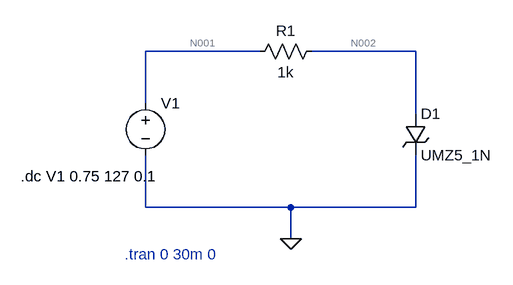
[diagram p0: schematic forward.asc]
forward.asc, the LTspice schematic file:
Version 4.1
SHEET 1 880 680
WIRE 16 128 -160 128
WIRE 256 128 96 128
WIRE -160 208 -160 128
WIRE 256 224 256 128
WIRE -160 368 -160 288
WIRE 64 368 -160 368
WIRE 256 368 256 288
WIRE 256 368 64 368
WIRE 64 416 64 368
FLAG 64 416 0
SYMBOL voltage -160 192 R0
WINDOW 123 0 0 Left 0
WINDOW 39 0 0 Left 0
SYMATTR InstName V1
SYMATTR Value ""
SYMBOL res 112 112 R90
WINDOW 0 0 56 VBottom 2
WINDOW 3 32 56 VTop 2
SYMATTR InstName R1
SYMATTR Value 1k
SYMBOL zener 240 224 R0
SYMATTR InstName D1
SYMATTR Value UMZ5_1N
SYMATTR Description Diode
SYMATTR Type diode
TEXT -192 440 Left 2 ;.tran 0 30m 0
TEXT -352 320 Left 2 !.dc V1 0.75 127 0.1

The netlist it stands for:
* forward.asc
V1 N001 0
R1 N002 N001 1k
D1 N002 0 UMZ5_1N
.model D D
.lib standard.dio
* .tran 0 30m 0
.dc V1 0.75 127 0.1
.backanno
.end

* Results of the author's LTspice run, read from the files saved beside the schematic
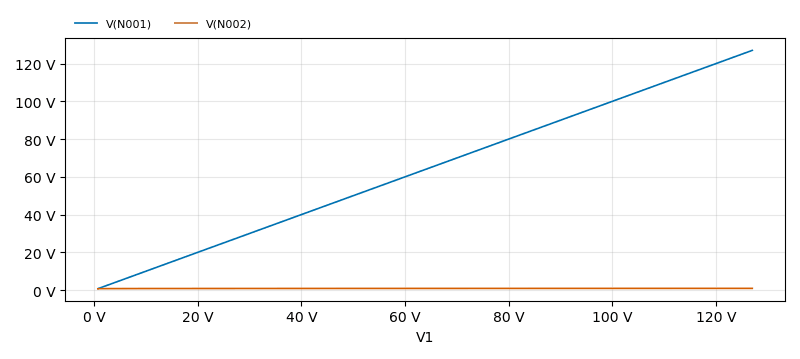
[diagram p1: DC transfer characteristic of forward.asc, plotted from the saved traces]
* DC transfer characteristic, 1 run:
*   V(N001): 750 mV at V1=750 mV, 127 V at V1=127 V, min 750 mV, max 127 V
*   V(N002): 688.8 mV at V1=750 mV, 923.3 mV at V1=127 V, min 688.8 mV, max 923.3 mV